# Altium project HAKUHO.PrjPcb
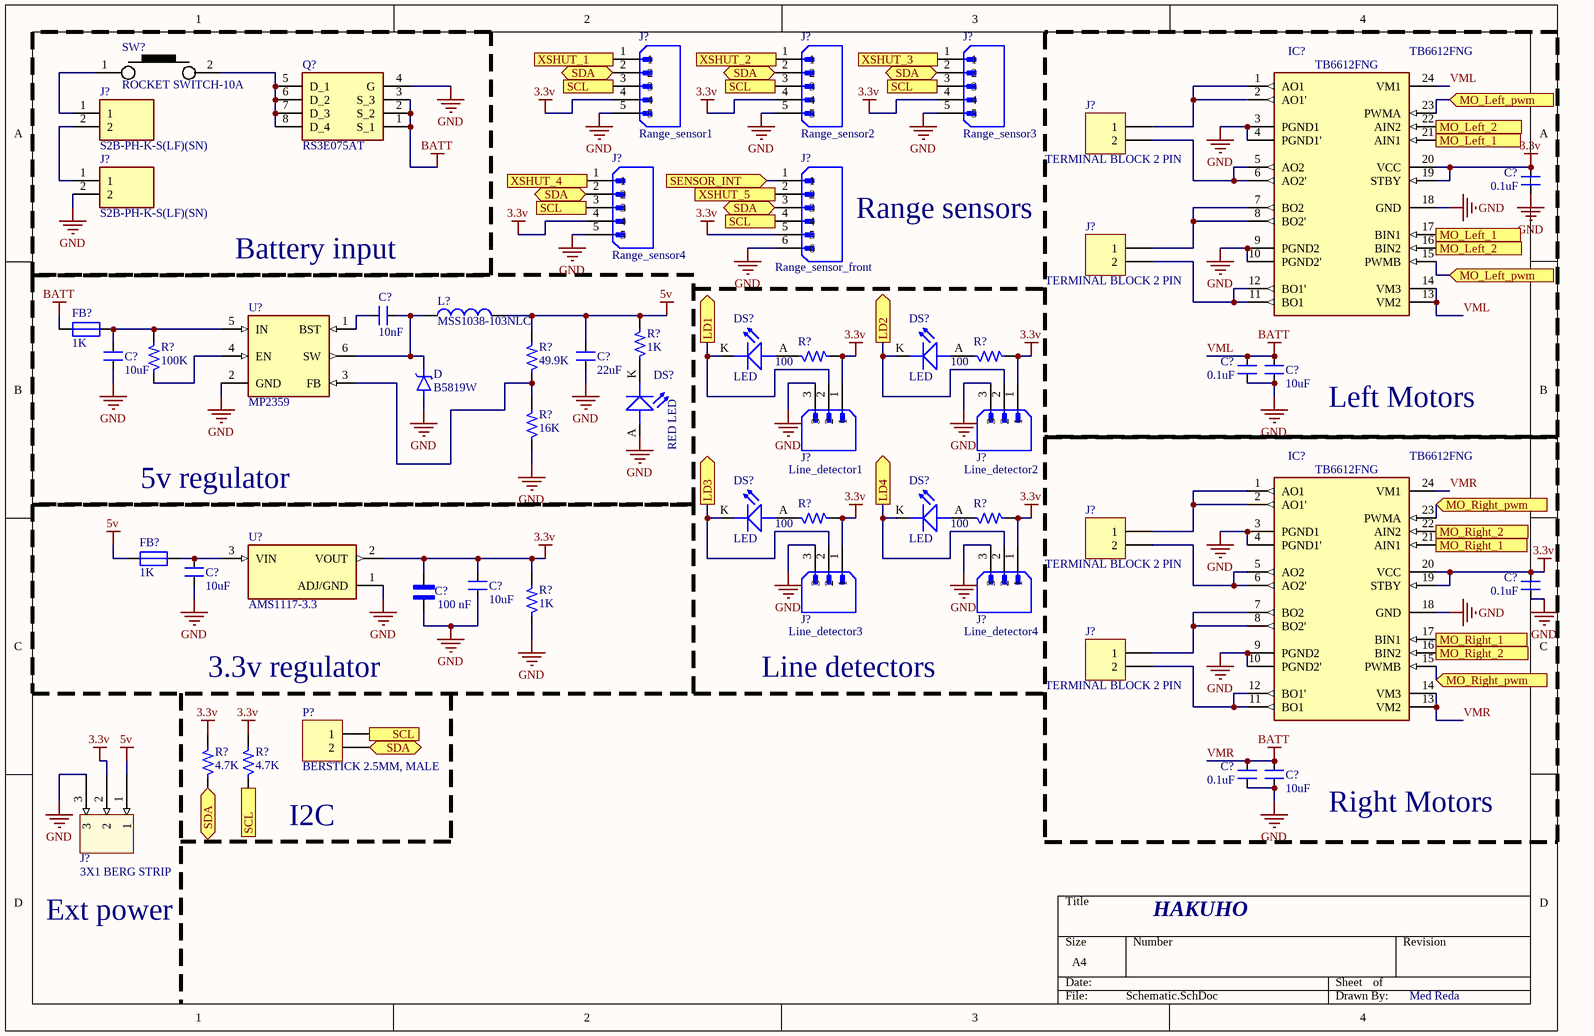
[diagram p0: Schematic.SchDoc]
2 sheets, 64 parts. Net scope: flat (ports and power ports of the same name join across sheets).
Sheets:
  Schematic.SchDoc
  Mcu.SchDoc

## Sheet Schematic.SchDoc
size A4; SheetNumber: 1; SheetTotal: 2

### Parts
(Parts that share a designator on the sheet are numbered #1, #2 ... from top to bottom, then left to right.)
C?#1  0.1uF  [CAP_0805]
C?#2  10nF  [CAP_0805]
C?#3  10uF  [CAP_1206]
C?#4  22uF  [CAP_0805]
C?#5  0.1uF  [CAP_0805]
C?#6  10uF  [CAP_1206]
C?#7  10uF  [CAP_1206]
C?#8  10uF  [CAP_1206]
C?#9  0.1uF  [CAP_0805]
C?#10  100 nF  [CAPC3216X100N]
C?#11  0.1uF  [CAP_0805]
C?#12  10uF  [CAP_1206]
D  B5819W  [SOD-123]
DS?#1  LED  [LED_0805]
DS?#2  LED  [LED_0805]
DS?#3  RED LED  [LED_0805]
DS?#4  LED  [LED_0805]
DS?#5  LED  [LED_0805]
FB?#1  1K  [IND_0805]
FB?#2  1K  [IND_0805]
IC?#1  TB6612FNG  [SSOP24]
IC?#2  TB6612FNG  [SSOP24]
J?#1  Range_sensor1  [MOLEX_530480510]
J?#2  Range_sensor2  [MOLEX_530480510]
J?#3  Range_sensor3  [MOLEX_530480510]
J?#4  S2B-PH-K-S(LF)(SN)  [JST_S2B-PH-K-S(LF)(SN)]
J?#5  TERMINAL BLOCK 2 PIN  [CON2_P196_1729128_TH_ST]
J?#6  S2B-PH-K-S(LF)(SN)  [JST_S2B-PH-K-S(LF)(SN)]
J?#7  Range_sensor4  [MOLEX_530480510]
J?#8  Range_sensor_front  [MOLEX_530480610]
J?#9  TERMINAL BLOCK 2 PIN  [CON2_P196_1729128_TH_ST]
J?#10  Line_detector1  [MOLEX_530480310]
J?#11  Line_detector2  [MOLEX_530480310]
J?#12  TERMINAL BLOCK 2 PIN  [CON2_P196_1729128_TH_ST]
J?#13  Line_detector3  [MOLEX_530480310]
J?#14  Line_detector4  [MOLEX_530480310]
J?#15  TERMINAL BLOCK 2 PIN  [CON2_P196_1729128_TH_ST]
J?#16  3X1 BERG STRIP  [CON3_100_40D72_TH_ST-MALE]
L?  MSS1038-103NLC  [IND_370_401_140X70_SMD]
P?  BERSTICK 2.5MM, MALE  [CON2_100_43D62_TH_ST]
Q?  RS3E075AT  [SOIC127P600X175-8N]
R?#1  100  [RES_0603]
R?#2  100  [RES_0603]
R?#3  1K  [RES_0603]
R?#4  100K  [RES_0603]
R?#5  49.9K  [RES_0805]
R?#6  16K  [RES_0805]
R?#7  100  [RES_0603]
R?#8  100  [RES_0603]
R?#9  1K  [RES_0603]
R?#10  4.7K  [RES_0603]
R?#11  4.7K  [RES_0603]
SW?#1  ROCKET SWITCH-10A  [SW_2ARS_TH]
U?#1  MP2359  [SOT-23-6]
U?#2  AMS1117-3.3  [SOT229P700X180-4N]

### Blocks framed on the sheet
Battery input: J?#4 J?#6 Q? SW?#1
Left Motors: C?#1 C?#5 C?#6 IC?#1 J?#5 J?#9
5v regulator: C?#2-C?#4 D DS?#3 FB?#1 L? R?#3-R?#6 U?#1
Right Motors: C?#9 C?#11 C?#12 IC?#2 J?#12 J?#15
3.3v regulator: C?#7 C?#8 C?#10 FB?#2 R?#9 U?#2

### Ports
LD1 (out, see Mcu[2B]), LD2 (out, see Mcu[2B]), LD3 (out, see Mcu[2B]), LD4 (out, see Mcu[2B]), MO_Left_1 (in, see Mcu[1B], Schematic[4A]), MO_Left_2 (in, see Mcu[1B], Schematic[4A]), MO_Left_pwm (in, see Mcu[1B], Schematic[4A]), MO_Left_pwm (in, see Mcu[1B], Schematic[4B]), MO_Right_1 (in, see Mcu[1B], Schematic[4C]), MO_Right_2 (in, see Mcu[1B], Schematic[4C]), MO_Right_pwm (in, see Mcu[1B], Schematic[4B]), MO_Right_pwm (in, see Mcu[1B], Schematic[4C]), SCL (in, see Mcu[1A], Schematic[1C], Schematic[1D], Schematic[2A]), SCL (in, see Mcu[1A], Schematic[1C], Schematic[1D], Schematic[2A], Schematic[3A]), SCL (in, see Mcu[1A], Schematic[1D], Schematic[2A], Schematic[3A]), SCL (out, see Mcu[1A], Schematic[1C], Schematic[2A], Schematic[3A]), SDA (bidir, see Mcu[1A], Schematic[1C], Schematic[1D], Schematic[2A]), SDA (bidir, see Mcu[1A], Schematic[1C], Schematic[1D], Schematic[2A], Schematic[3A]), SDA (bidir, see Mcu[1A], Schematic[1C], Schematic[2A], Schematic[3A]), SDA (bidir, see Mcu[1A], Schematic[1D], Schematic[2A], Schematic[3A]), SENSOR_INT (in, see Mcu[2B]), XSHUT_1 (in, see Mcu[2B]), XSHUT_2 (in, see Mcu[2B]), XSHUT_3 (in, see Mcu[2B]), XSHUT_4 (in, see Mcu[2B]), XSHUT_5 (in, see Mcu[2B])

### Nets
3.3v: C?#1.2 C?#8.2 C?#9.2 C?#10.2 IC?#1.19(STBY) IC?#1.20(VCC) IC?#2.19(STBY) IC?#2.20(VCC) J?#1.4 J?#2.4 J?#3.4 J?#7.4 J?#8.5 J?#10.1 J?#11.1 J?#13.1 J?#14.1 J?#16.2 R?#1.2 R?#2.2 R?#7.2 R?#8.2 R?#9.2 R?#10.2 R?#11.2 U?#2.2(VOUT)
5v: C?#4.2 FB?#2.1 J?#16.1 L?.2 R?#3.2 R?#5.2
GND: C?#1.1 C?#3.1 C?#4.1 C?#5.1 C?#6.1 C?#7.1 C?#8.1 C?#9.1 C?#10.1 C?#11.1 C?#12.1 D.A DS?#3.A(ANODE) IC?#1.3(PGND1) IC?#1.4(PGND1') IC?#1.9(PGND2) IC?#1.10(PGND2') IC?#1.18(GND) IC?#2.3(PGND1) IC?#2.4(PGND1') IC?#2.9(PGND2) IC?#2.10(PGND2') IC?#2.18(GND) J?#1.5 J?#2.5 J?#3.5 J?#6.2 J?#7.5 J?#8.6 J?#10.3 J?#11.3 J?#13.3 J?#14.3 J?#16.3 Q?.4(G) R?#6.1 R?#9.1 U?#1.2(GND) U?#2.1(ADJ/GND)
VML: C?#5.2 C?#6.2 C?#11.2 C?#12.2 FB?#1.1 IC?#1.13(VM2) IC?#1.14(VM3) IC?#1.24(VM1) IC?#2.13(VM2) IC?#2.14(VM3) IC?#2.24(VM1) Q?.1(S_1) Q?.2(S_2) Q?.3(S_3)  [also labelled BATT, VMR]
NetC?#2_1: C?#2.1 U?#1.1(BST)
NetC?#2_2: C?#2.2 D.C L?.1 U?#1.6(SW)
NetC?#3_2: C?#3.2 FB?#1.2 R?#4.2 U?#1.5(IN)
NetC?#7_2: C?#7.2 FB?#2.2 U?#2.3(VIN)
NetDS?#1_A: DS?#1.A(ANODE) R?#1.1
NetDS?#1_K: DS?#1.K(CATHODE) J?#10.2 ; port LD1
NetDS?#2_A: DS?#2.A(ANODE) R?#2.1
NetDS?#2_K: DS?#2.K(CATHODE) J?#11.2 ; port LD2
NetDS?#3_K: DS?#3.K(CATHODE) R?#3.1
NetDS?#4_A: DS?#4.A(ANODE) R?#7.1
NetDS?#4_K: DS?#4.K(CATHODE) J?#13.2 ; port LD3
NetDS?#5_A: DS?#5.A(ANODE) R?#8.1
NetDS?#5_K: DS?#5.K(CATHODE) J?#14.2 ; port LD4
NetIC?#1_1: IC?#1.1(AO1) IC?#1.2(AO1') J?#5.1
NetIC?#1_5: IC?#1.5(AO2) IC?#1.6(AO2') J?#5.2
NetIC?#1_7: IC?#1.7(BO2) IC?#1.8(BO2') J?#9.1
NetIC?#1_11: IC?#1.11(BO1) IC?#1.12(BO1') J?#9.2
NetIC?#1_15: IC?#1.15(PWMB) IC?#1.23(PWMA) ; port MO_Left_pwm
NetIC?#1_16: IC?#1.16(BIN2) IC?#1.22(AIN2) ; port MO_Left_2
NetIC?#1_17: IC?#1.17(BIN1) IC?#1.21(AIN1) ; port MO_Left_1
NetIC?#2_1: IC?#2.1(AO1) IC?#2.2(AO1') J?#12.1
NetIC?#2_5: IC?#2.5(AO2) IC?#2.6(AO2') J?#12.2
NetIC?#2_7: IC?#2.7(BO2) IC?#2.8(BO2') J?#15.1
NetIC?#2_11: IC?#2.11(BO1) IC?#2.12(BO1') J?#15.2
NetIC?#2_15: IC?#2.15(PWMB) IC?#2.23(PWMA) ; port MO_Right_pwm
NetIC?#2_16: IC?#2.16(BIN2) IC?#2.22(AIN2) ; port MO_Right_2
NetIC?#2_17: IC?#2.17(BIN1) IC?#2.21(AIN1) ; port MO_Right_1
NetJ?#1_1: J?#1.1 ; port XSHUT_1
NetJ?#1_2: J?#1.2 J?#2.2 J?#3.2 J?#7.2 J?#8.3 P?.2 R?#10.1 ; port SDA
NetJ?#1_3: J?#1.3 J?#2.3 J?#3.3 J?#7.3 J?#8.4 P?.1 R?#11.1 ; port SCL
NetJ?#3_1: J?#3.1 ; port XSHUT_3
NetJ?#4_1: J?#4.1 SW?#1.1
NetJ?#4_2: J?#4.2 J?#6.1
NetJ?#8_1: J?#8.1 ; port SENSOR_INT
NetJ?#8_2: J?#8.2 ; port XSHUT_5
NetQ?_5: Q?.5(D_1) Q?.6(D_2) Q?.7(D_3) Q?.8(D_4) SW?#1.2
NetR?#4_1: R?#4.1 U?#1.4(EN)
NetR?#5_1: R?#5.1 R?#6.2 U?#1.3(FB)

Not connected (* = marked no-connect by the designer): J?#2 1; J?#7 1

### Notes on the sheet
- Range sensors
- Line detectors
- I2C
- Ext power
- HAKUHO
- Med Reda

### Library data of the parts
C?#1 C?#5 C?#9 C?#11 = CAP_0.1uF-50V-10%-0805: 0.1µF ±10% 50V Ceramic Capacitor X7R 0805 (2012 Metric); Manufacturer: Samsung; Manufacturer Part Number: CL21B104KBCNNNC; Alternate Part Number-1: NA; Case/Package: 0805; Supplier-1: SIRICOM; Supplier Part Number-1: 0805B104K500CT
C?#2 = CAP_10nF-50V-10%-0805: 10000pF ±10% 50V Ceramic Capacitor X7R 0805 (2012 Metric); Manufacturer: Samsung; Manufacturer Part Number: C0805C103K5RECAUTO; Alternate Part Number-1: GRM2195C1H103JA01D; Case/Package: 0805; Supplier-1: SIRICOM; Supplier Part Number-1: 0805B103K500CT
C?#3 C?#6-C?#8 C?#12 = CAP_10uF-50V-10%-1206: 10µF ±10% 50V Ceramic Capacitor X7R 1206 (3216 Metric); Manufacturer: KEMET; Manufacturer Part Number: CL31B106KBHNNNE; Alternate Part Number-1: GRT31CR61H106ME01L; Case/Package: 1206; Supplier-1: SIRICOM; Supplier Part Number-1: CC1206KKX5R9BB106
C?#4 = CAP_22uF-25V-20%-0805: 22µF ±20% 25V Ceramic Capacitor X5R 0805 (2012 Metric); Manufacturer: Murata; Manufacturer Part Number: GRM21BR61E226ME44L; Alternate Part Number-1: NA; Case/Package: 0805; Supplier-1: LCSC; Supplier Part Number-1: C86816
C?#10 = CL31B104KBCNNNC: Ceramic capacitor SMD 1206 100 nF 50 V 10 % Samsung Electro-Mechanics CL31B104KBCNNNC 4000 pc(s); SnapEDA_Link: https://www.snapeda.com/parts/CL31B104KBCNNNC/Samsung/view-part/?ref=snap; Package: SMD-2 Samsung; Value: *; MF: Samsung Electro-Mechanics; MP: CL31B104KBCNNNC; Check_prices: https://www.snapeda.com/parts/CL31B104KBCNNNC/Samsung/view-part/?ref=eda
D = B5819W: MF: Taiwan Semiconductor; SnapEDA_Link: https://www.snapeda.com/parts/B5819W/Taiwan%20Semiconductor/view-part/105688/?ref=snap; MP: B5819W; Availability: Unavailable; Price: None; Value: *; Package: SOD-123 Taiwan Semiconductor
DS?#1-DS?#5 = LED_RED-2V-20mA-0805: Red 631nm LED Indication - Discrete 2V 0805 (2012 Metric); Manufacturer: Vishay Lite-On; Manufacturer Part Number: LTST-C171KRKT; Alternate Part Number-1: NA; Case/Package: 0805; Supplier-1: SP ROAD; Supplier Part Number-1: LTST-C171KRKT
FB?#1 FB?#2 = FB_1K-100MHZ-1.6A-0805: 1 kOhms @ 100MHz 1 Power Line Ferrite Bead 0805 (2012 Metric) 1.6A; Manufacturer: Laird; Manufacturer Part Number: BLM21SP102SH1D; Alternate Part Number-1: NA; Case/Package: 0805; Supplier-1: SIRICOM; Supplier Part Number-1: ACMS201209A102
IC?#1 IC?#2 = TB6612FNG: - Motor Driver Power MOSFET Parallel 24-SSOP; MF: Toshiba; SnapEDA_Link: https://www.snapeda.com/parts/TB6612FNG/Toshiba/view-part/?ref=snap; Package: None; Value: *; MP: TB6612FNG; Check_prices: https://www.snapeda.com/parts/TB6612FNG/Toshiba/view-part/?ref=eda
J?#1-J?#3 J?#7 = 530480510: Value: *; Price: None; Availability: Unavailable; MP: 530480510; Package: None
J?#4 J?#6 = S2B-PH-K-S(LF)(SN): Connector Header Through Hole, Right Angle 2 position; MF: JST Sales America Inc.; SnapEDA_Link: https://www.snapeda.com/parts/S2B-PH-K-S(LF)(SN)/JST/view-part/?ref=snap; Package: NON STANDARD-2 J.S.T.; Value: *; MP: S2B-PH-K-S(LF)(SN); Check_prices: https://www.snapeda.com/parts/S2B-PH-K-S(LF)(SN)/JST/view-part/?ref=eda
J?#5 J?#9 J?#12 J?#15 = CON-TB_2X1-196-ST-TH: 2 Pins, 1 Row 5mm Pitch, straight Connector, male; Manufacturer: Phoenix Contact; Manufacturer Part Number: MKDSN1,5/2; Alternate Part Number-1: NA; Case/Package: TH-CON; Supplier-1: SP ROAD; Supplier Part Number-1: MKDSN1,5/2
J?#8 = 530480610: Package: None; Price: None; Value: *; MP: 530480610; Availability: Unavailable
J?#10 J?#11 J?#13 J?#14 = 530480310: Package: None; MP: 530480310; Value: *; Availability: Unavailable; Price: None
J?#16 = CON-BS-PLG_3X1-100-ST-TH: 3 Pins, 1 Row 2.54mm Pitch, Straight bergstrip, Male; Manufacturer: NA; Manufacturer Part Number: RKI-1140; Case/Package: TH-CON; Supplier-1: SP ROAD; Supplier Part Number-1: NA; Alternate Part Number-1: NA
L? = IND_10uH-4A-30%-SMD: Fixed Inductors MSS1038 SMT Shielded 10 uH 30 % 4.05 A; Manufacturer: Coilcraft; Alternate Part Number-1: NA; Manufacturer Part Number: MSS1038-103NLC; Case/Package: SMD; Supplier-1: COILCRAFT SAMPLE; Supplier Part Number-1: MSS1038-103NLB
P? = CON-BS-PLG_2X1-100-ST-TH: 2 Pins, 1 Row 2.54mm Pitch, Straight bergstrip, Male; Manufacturer Part Number: NA; Manufacturer: Samtec; Case/Package: TH-CON; Supplier-1: SP ROAD; Supplier Part Number-1: NA; Alternate Part Number-1: NA
Q? = RS3E075AT: Pch -30V -7.5A Middle Power MOSFET; Manufacturer_Name: ROHM Semiconductor; Geometry.Height: 1.75mm; Manufacturer_Part_Number: RS3E075AT; Mouser Part Number: N/A; Mouser Price/Stock: https://www.mouser.co.uk/ProductDetail/ROHM-Semiconductor/RS3E075AT?qs=W0yvOO0ixfG3uBr1%252BCakYg%3D%3D; Arrow Part Number: *; Arrow Price/Stock: *; Datasheet Link: https://fscdn.rohm.com/en/products/databook/datasheet/discrete/transistor/mosfet/rs3e075attb1-e.pdf
R?#1 R?#2 R?#7 R?#8 = RES_100R-0.1W-1%-0603: 100 Ohms ±1% 0.1W, 1/10W Chip Resistor 0603 (1608 Metric) Thick Film; Manufacturer: Walsin; Manufacturer Part Number: WR06X1000FTL; Alternate Part Number-1: MR06X1000FTL; Case/Package: 0603; Supplier-1: SIRICOM; Supplier Part Number-1: WALSIN:WR06X1000FTL
R?#3 R?#9 = RES_1K-0.1W-1%-0603: 1 kOhms ±1% 0.1W, 1/10W Chip Resistor 0603 (1608 Metric) Automotive AEC-Q200 Thick Film; Manufacturer: Walsin; Manufacturer Part Number: WR06X1001FTL; Alternate Part Number-1: 0603WAF1001T5E; Case/Package: 0603; Supplier-1: SIRICOM; Supplier Part Number-1: WR06X1001FTL
R?#4 = RES_100K-0.1W-1%-0603: 100 kOhms ±1% 0.1W, 1/10W Chip Resistor 0603 (1608 Metric) Automotive AEC-Q200 Thick Film; Manufacturer: Stackpole Electronics; Manufacturer Part Number: RMCF0603FT100K; Alternate Part Number-1: NA; Case/Package: 0603; Supplier-1: Arrow; Supplier Part Number-1: RMCF0603FT100K
R?#5 = RES_49.9K-0.125W-1%-0805: 49.9 kOhms ±1% 0.125W, 1/8W Chip Resistor 0805 (2012 Metric) Anti-Sulfur, Automotive AEC-Q200 Thick Film; Manufacturer: Stackpole Electronics; Manufacturer Part Number: RCA080549K9FKEA; Alternate Part Number-1: NA; Case/Package: 0805; Supplier-1: SP ROAD; Supplier Part Number-1: RCA080549K9FKEA
R?#6 = RES_16K-0.125W-5%-0805: 16 kOhms ±5% 0.125W, 1/8W Chip Resistor 0805 (2012 Metric) Moisture Resistant Thick Film; Manufacturer: Panasonic; Manufacturer Part Number: RC0805JR-0716KL; Alternate Part Number-1: NA; Case/Package: 0805; Supplier-1: SIRICOM; Supplier Part Number-1: WR08X1502FTL
R?#10 R?#11 = RES_4.7K-0.1W-1%-0603: 4.7 kOhms ±1% 0.1W, 1/10W Chip Resistor 0603 (1608 Metric) Moisture Resistant Thick Film; Manufacturer: Walsin; Manufacturer Part Number: WR06X4701FTL; Alternate Part Number-1: MR06X4701FTL; Case/Package: 0603; Supplier-1: SIRICOM; Supplier Part Number-1: WR06X4701FTL
SW?#1 = SW1_10A-SRB23A2BBBNN-TH: Rocker Switch SPDT 10A (AC) 125V Panel Mount, Snap-In; Manufacturer: ITT C&K; Alternate Part Number-1: NA; Manufacturer Part Number: SRB23A2BBBNN; Case/Package: TH; Supplier-1: SP ROAD; Supplier Part Number-1: SRB23A2BBBNN
U?#1 = MP2359: 1.2A, 24V, 1.4MHz Step-Down Converter in a TSOT23-6; MF: Monolithic Power Systems Inc.; SnapEDA_Link: https://www.snapeda.com/parts/MP2359/Monolithic+Power+Systems+Inc./view-part/?ref=snap; Package: None; Value: *; MP: MP2359; Check_prices: https://www.snapeda.com/parts/MP2359/Monolithic+Power+Systems+Inc./view-part/?ref=eda
U?#2 = AMS1117-3.3: Linear Voltage Regulator IC Positive Fixed 1 Output 1A SOT-223-3L; MF: UMW; SnapEDA_Link: https://www.snapeda.com/parts/AMS1117-3.3/UMW/view-part/?ref=snap; Package: SOT-223-3L UMW; Value: *; MP: AMS1117-3.3; Check_prices: https://www.snapeda.com/parts/AMS1117-3.3/UMW/view-part/?ref=eda

## Sheet Mcu.SchDoc
size A4; SheetNumber: 2; SheetTotal: 2
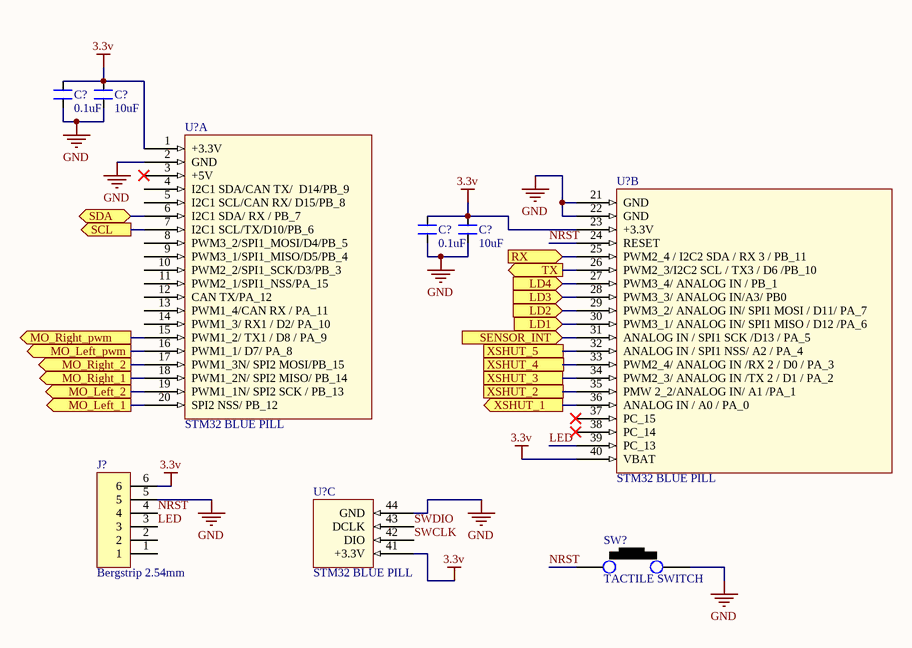
[diagram p1: Mcu.SchDoc]

### Parts
(Parts that share a designator on the sheet are numbered #1, #2 ... from top to bottom, then left to right.)
C?#13  0.1uF  [CAP_0805]
C?#14  10uF  [CAP_1206]
C?#15  0.1uF  [CAP_0805]
C?#16  10uF  [CAP_1206]
J?#17  Bergstrip 2.54mm  [CON6_100_59D78_TH_ST]
SW?#2  TACTILE SWITCH  [SW_342_SMD]
U?#3  STM32 BLUE PILL  [MOD_STM-BLUE-PILL]  (part A of 3)
U?#4  STM32 BLUE PILL  [MOD_STM-BLUE-PILL]  (part B of 3)
U?#5  STM32 BLUE PILL  [MOD_STM-BLUE-PILL]  (part C of 3)

### Ports
LD1 (in, see Schematic[2B]), LD2 (in, see Schematic[3B]), LD3 (in, see Schematic[2B]), LD4 (in, see Schematic[3B]), MO_Left_1 (out, see Schematic[4A]), MO_Left_2 (out, see Schematic[4A]), MO_Left_pwm (out, see Schematic[4A], Schematic[4B]), MO_Right_1 (out, see Schematic[4C]), MO_Right_2 (out, see Schematic[4C]), MO_Right_pwm (out, see Schematic[4B], Schematic[4C]), RX (in), SCL (out, see Schematic[1C], Schematic[1D], Schematic[2A], Schematic[3A]), SDA (bidir, see Schematic[1C], Schematic[1D], Schematic[2A], Schematic[3A]), SENSOR_INT (in, see Schematic[2A]), TX (out), XSHUT_1 (out, see Schematic[2A]), XSHUT_2 (out, see Schematic[2A]), XSHUT_3 (out, see Schematic[3A]), XSHUT_4 (out, see Schematic[2A]), XSHUT_5 (out, see Schematic[2A])

### Nets
3.3v: C?#13.2 C?#14.2 C?#15.2 C?#16.2 J?#17.6 U?#3.1(+3.3V) U?#4.23(+3.3V) U?#4.40(VBAT) U?#5.41(+3.3V)
GND: C?#13.1 C?#14.1 C?#15.1 C?#16.1 J?#17.5 SW?#2.2 U?#3.2(GND) U?#4.21(GND) U?#4.22(GND) U?#5.44(GND)
LED: J?#17.3 U?#4.39(PC_13)
NRST: J?#17.4 SW?#2.1 U?#4.24(RESET)
SWCLK: U?#5.42(DIO)
SWDIO: U?#5.43(DCLK)
NetDS?#1_K: U?#4.30(PWM3_1/_ANALOG_IN/_SPI1_MISO_/_D12_/PA_6) ; port LD1
NetDS?#2_K: U?#4.29(PWM3_2/_ANALOG_IN/_SPI1_MOSI_/_D11/_PA_7) ; port LD2
NetDS?#4_K: U?#4.28(PWM3_3/_ANALOG_IN/A3/_PB0) ; port LD3
NetDS?#5_K: U?#4.27(PWM3_4/_ANALOG_IN_/_PB_1) ; port LD4
NetIC?#1_15: U?#3.16(PWM1_1/_D7/_PA_8) ; port MO_Left_pwm
NetIC?#1_16: U?#3.19(PWM1_1N/_SPI2_SCK_/_PB_13) ; port MO_Left_2
NetIC?#1_17: U?#3.20(SPI2_NSS/_PB_12) ; port MO_Left_1
NetIC?#2_15: U?#3.15(PWM1_2/_TX1_/_D8_/_PA_9) ; port MO_Right_pwm
NetIC?#2_16: U?#3.17(PWM1_3N/_SPI2_MOSI/PB_15) ; port MO_Right_2
NetIC?#2_17: U?#3.18(PWM1_2N/_SPI2_MISO/_PB_14) ; port MO_Right_1
NetJ?#1_1: U?#4.36(ANALOG_IN_/_A0_/_PA_0) ; port XSHUT_1
NetJ?#1_2: U?#3.6(I2C1_SDA/_RX_/_PB_7) ; port SDA
NetJ?#1_3: U?#3.7(I2C1_SCL/TX/D10/PB_6) ; port SCL
NetJ?#3_1: U?#4.34(PWM2_3/_ANALOG_IN_/TX_2_/_D1_/_PA_2) ; port XSHUT_3
NetJ?#8_1: U?#4.31(ANALOG_IN_/_SPI1_SCK_/D13_/_PA_5) ; port SENSOR_INT
NetJ?#8_2: U?#4.32(ANALOG_IN_/_SPI1_NSS/_A2_/_PA_4) ; port XSHUT_5
NetU?#4_25: U?#4.25(PWM2_4_/_I2C2_SDA_/_RX_3_/_PB_11) ; port RX
NetU?#4_26: U?#4.26(PWM2_3/I2C2_SCL_/_TX3_/_D6_/PB_10) ; port TX
NetU?#4_33: U?#4.33(PWM2_4/_ANALOG_IN_/RX_2_/_D0_/_PA_3) ; port XSHUT_4
NetU?#4_35: U?#4.35(PMW_2_2/ANALOG_IN/_A1_/PA_1) ; port XSHUT_2

Not connected (* = marked no-connect by the designer): J?#17 1 2; U?#3 3(+5V)* 4(I2C1_SDA/CAN_TX/__D14/PB_9) 5(I2C1_SCL/CAN_RX/_D15/PB_8) 8(PWM3_2/SPI1_MOSI/D4/PB_5) 9(PWM3_1/SPI1_MISO/D5/PB_4) 10(PWM2_2/SPI1_SCK/D3/PB_3) 11(PWM2_1/SPI1_NSS/PA_15) 12(CAN_TX/PA_12) 13(PWM1_4/CAN_RX_/_PA_11) 14(PWM1_3/_RX1_/_D2/_PA_10); U?#4 37(PC_15)* 38(PC_14)*

### Library data of the parts
C?#13 C?#15 = CAP_0.1uF-50V-5%-0805: 0.1µF ±5% 50V Ceramic Capacitor X7R 0805 (2012 Metric); Manufacturer: AVX Corporation; Manufacturer Part Number: 08055C104JAT4A; Alternate Part Number-1: 0805B104M500; Case/Package: 0805; Supplier-1: SIRICOM; Supplier Part Number-1: 0805B104J500CT
C?#14 C?#16 = CAP_10uF-50V-10%-1206: as C?#3 on sheet Schematic; Case/Package: 1206; Supplier-1: SIRICOM; Supplier Part Number-1: CC1206KKX5R9BB106
J?#17 = CON-BS-SKT_6X1-100-ST-TH: 6 Pins, 1 Row 2.54mm Pitch, Straight bergstrip, Female; Manufacturer: Molex; Alternate Part Number-1: NA; Manufacturer Part Number: 22-10-2061; Case/Package: TH-CON; Supplier-1: SP ROAD; Supplier Part Number-1: NA
SW?#2 = SW1_RS-282G05A3-SMRT-SMD: Tactile Switch SPST-NO Top Actuated Surface Mount; Manufacturer: ITT C&K; Alternate Part Number-1: NA; Manufacturer Part Number: RS-282G05A3-SMRT; Case/Package: SMD; Supplier-1: SP ROAD; Supplier Part Number-1: RS-282G05A3-SMRT
U?#3-U?#5 = MOD-STM32-BLUE PILL: Manufacturer Part Number: NA; Case/Package: TH; Manufacturer: NA; Supplier-1: SP ROAD; Supplier Part Number-1: NA; Alternate Part Number-1: NA

## Nets that join several sheets
3.3v: Schematic (26 pins), Mcu (9 pins)
GND: Schematic (39 pins), Mcu (10 pins)
NetDS?#1_K: Schematic (DS?#1.K J?#10.2), Mcu (U?#4.30)
NetDS?#2_K: Schematic (DS?#2.K J?#11.2), Mcu (U?#4.29)
NetDS?#4_K: Schematic (DS?#4.K J?#13.2), Mcu (U?#4.28)
NetDS?#5_K: Schematic (DS?#5.K J?#14.2), Mcu (U?#4.27)
NetIC?#1_15: Schematic (IC?#1.15 IC?#1.23), Mcu (U?#3.16)
NetIC?#1_16: Schematic (IC?#1.16 IC?#1.22), Mcu (U?#3.19)
NetIC?#1_17: Schematic (IC?#1.17 IC?#1.21), Mcu (U?#3.20)
NetIC?#2_15: Schematic (IC?#2.15 IC?#2.23), Mcu (U?#3.15)
NetIC?#2_16: Schematic (IC?#2.16 IC?#2.22), Mcu (U?#3.17)
NetIC?#2_17: Schematic (IC?#2.17 IC?#2.21), Mcu (U?#3.18)
NetJ?#1_1: Schematic (J?#1.1), Mcu (U?#4.36)
NetJ?#1_2: Schematic (7 pins), Mcu (U?#3.6)
NetJ?#1_3: Schematic (7 pins), Mcu (U?#3.7)
NetJ?#3_1: Schematic (J?#3.1), Mcu (U?#4.34)
NetJ?#8_1: Schematic (J?#8.1), Mcu (U?#4.31)
NetJ?#8_2: Schematic (J?#8.2), Mcu (U?#4.32)